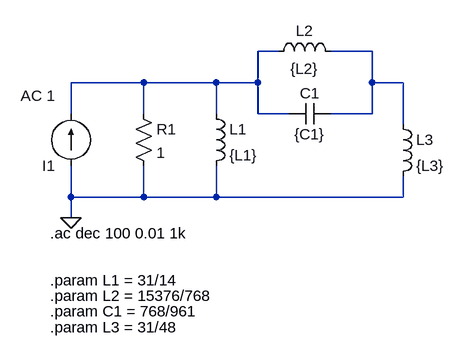
[diagram p0: schematic punto3.asc]
punto3.asc, the LTspice schematic file:
Version 4.1
SHEET 1 880 680
WIRE 272 32 240 32
WIRE 416 32 352 32
WIRE 64 80 -48 80
WIRE 176 80 64 80
WIRE 240 80 240 32
WIRE 240 80 176 80
WIRE 416 80 416 32
WIRE 464 80 416 80
WIRE -48 128 -48 80
WIRE 64 128 64 80
WIRE 176 128 176 80
WIRE 240 128 240 80
WIRE 288 128 240 128
WIRE 416 128 416 80
WIRE 416 128 352 128
WIRE 464 144 464 80
WIRE -48 256 -48 208
WIRE 64 256 64 208
WIRE 64 256 -48 256
WIRE 176 256 176 208
WIRE 176 256 64 256
WIRE 464 256 464 224
WIRE 464 256 176 256
WIRE -48 288 -48 256
FLAG -48 288 0
SYMBOL res 48 112 R0
SYMATTR InstName R1
SYMATTR Value 1
SYMBOL ind 160 112 R0
SYMATTR InstName L1
SYMATTR Value {L1}
SYMATTR SpiceLine Rser=1m
SYMBOL ind 256 48 R270
WINDOW 0 32 56 VTop 2
WINDOW 3 5 56 VBottom 2
SYMATTR InstName L2
SYMATTR Value {L2}
SYMATTR SpiceLine Rser=1m
SYMBOL cap 352 112 R90
WINDOW 0 0 32 VBottom 2
WINDOW 3 32 32 VTop 2
SYMATTR InstName C1
SYMATTR Value {C1}
SYMBOL ind 448 128 R0
SYMATTR InstName L3
SYMATTR Value {L3}
SYMATTR SpiceLine Rser=1m
SYMBOL current -48 208 R180
WINDOW 123 24 108 Left 2
WINDOW 39 0 0 Left 0
SYMATTR InstName I1
SYMATTR Value ""
SYMATTR Value2 AC 1
TEXT -80 312 Left 2 !.ac dec 100 0.01 1k
TEXT -80 384 Left 2 !.param L1 = 31/14
TEXT -80 408 Left 2 !.param L2 = 15376/768
TEXT -80 432 Left 2 !.param C1 = 768/961
TEXT -80 456 Left 2 !.param L3 = 31/48

The netlist it stands for:
* punto3.asc
R1 N001 0 1
L1 N001 0 {L1} Rser=1m
L2 N001 N002 {L2} Rser=1m
C1 N002 N001 {C1}
L3 N002 0 {L3} Rser=1m
I1 0 N001 AC 1
.ac dec 100 0.01 1k
.param L1 = 31/14
.param L2 = 15376/768
.param C1 = 768/961
.param L3 = 31/48
.backanno
.end